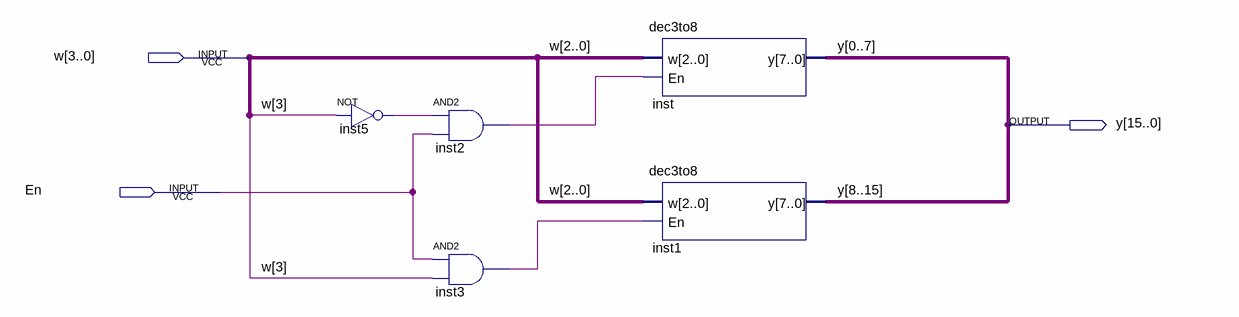
[diagram p0: schematic sheet]
// Quartus schematic dec4to16.bdf as structural Verilog: 5 symbols, 3 pins
module dec4to16 (
  input  [3:0] w,
  input  En,
  output [15:0] y
);

  wire inst2_out, inst3_out, inst5_out;

  not inst5 (inst5_out, w[3]);
  and inst2 (inst2_out, inst5_out, En);
  and inst3 (inst3_out, En, w[3]);
  dec3to8 inst (.w(w[2:0]), .En(inst2_out), .y({y[0], y[1], y[2], y[3], y[4], y[5], y[6], y[7]}));
  dec3to8 inst1 (.w(w[2:0]), .En(inst3_out), .y({y[8], y[9], y[10], y[11], y[12], y[13], y[14], y[15]}));
endmodule
